# Altium project Sim Demo.PrjPcb
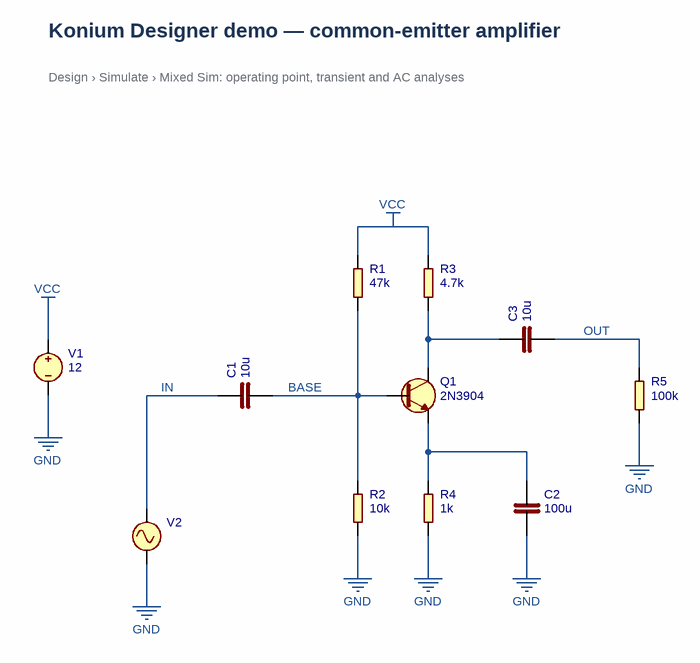
[diagram p0: Amplifier.SchDoc]
1 sheet, 11 parts. Net scope: global (net labels, ports and power ports of the same name join across sheets).

## Sheet Amplifier.SchDoc
size A4

### Parts
C1  10u
C2  100u
C3  10u
Q1  2N3904
R1  47k
R2  10k
R3  4.7k
R4  1k
R5  100k
V1  12
V2  VSIN  (value not drawn)

### Nets
GND: C2.2 R2.2 R4.2 R5.2 V1.2(-) V2.2(-)
VCC: R1.1 R3.1 V1.1(+)
BASE: C1.2 Q1.2(B) R1.2 R2.1
IN: C1.1 V2.1(+)
OUT: C3.2 R5.1
NetC2_1: C2.1 Q1.3(E) R4.1
NetC3_1: C3.1 Q1.1(C) R3.2

### Notes on the sheet
- Konium Designer demo — common-emitter amplifier
- Design › Simulate › Mixed Sim: operating point, transient and AC analyses

### Library data of the parts
C1-C3 = CAP: Capacitor
  C1 C3: Value: 10u
  C2: Value: 100u
Q1 = NPN: NPN bipolar transistor
R1-R5 = RES: Resistor
  R1: Value: 47k
  R2: Value: 10k
  R3: Value: 4.7k
  R4: Value: 1k
  R5: Value: 100k
V1 = VSRC: Voltage Source; Value: 12
V2 = VSIN: Sinusoidal Voltage Source